# Altium schematic sheet BMP581.SchDoc
size A; SheetNumber: 4; SheetTotal: 7
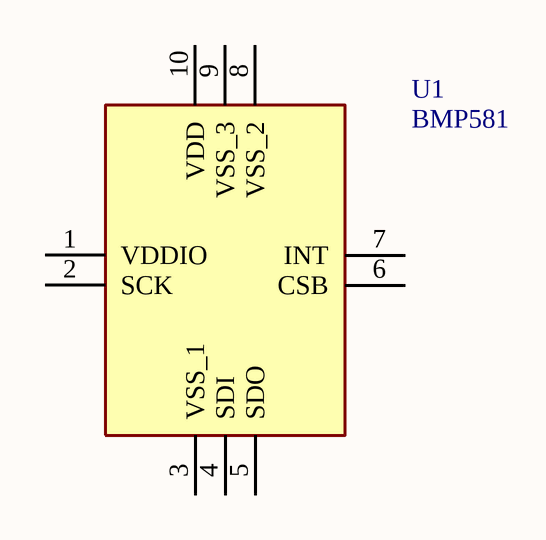
[diagram p0: BMP581.SchDoc]

## Parts
U1  BMP581  [BMP581]

## Nets

Not connected (* = marked no-connect by the designer): U1 1(VDDIO) 2(SCK) 3(VSS_1) 4(SDI) 5(SDO) 6(CSB) 7(INT) 8(VSS_2) 9(VSS_3) 10(VDD)

## Library data of the parts
U1 = BMP581: Undefined or Miscellaneous; Manufacturer_Name: BOSCH; Datasheet Link: https://www.bosch-sensortec.com/media/boschsensortec/downloads/datasheets/bst-bmp581-ds004.pdf; Height: 0.8mm; Manufacturer_Part_Number: BMP581; Mouser Part Number: 262-BMP581; Mouser Price/Stock: https://www.mouser.co.uk/ProductDetail/Bosch-Sensortec/BMP581?qs=Li%252BoUPsLEntPL9tlFmcgXg%3D%3D; Arrow Part Number: BMP581; Arrow Price/Stock: https://www.arrow.com/en/products/bmp581/bosch-sensortec?utm_currency=USD&region=nac